# EasyEDA Pro project 集成板.eprj, board 平推转线板3.1
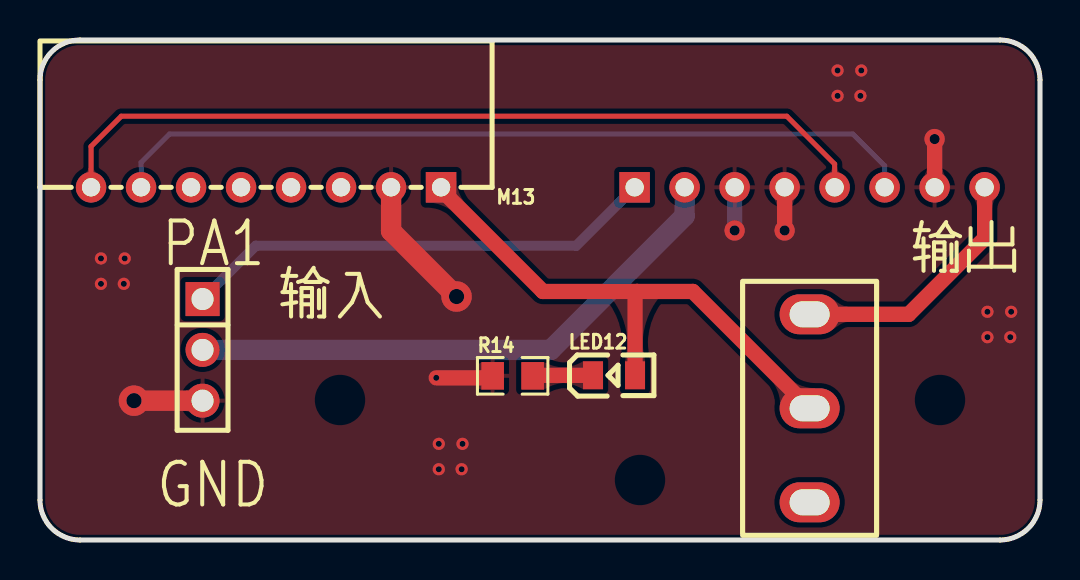
[diagram p8: board, top side]
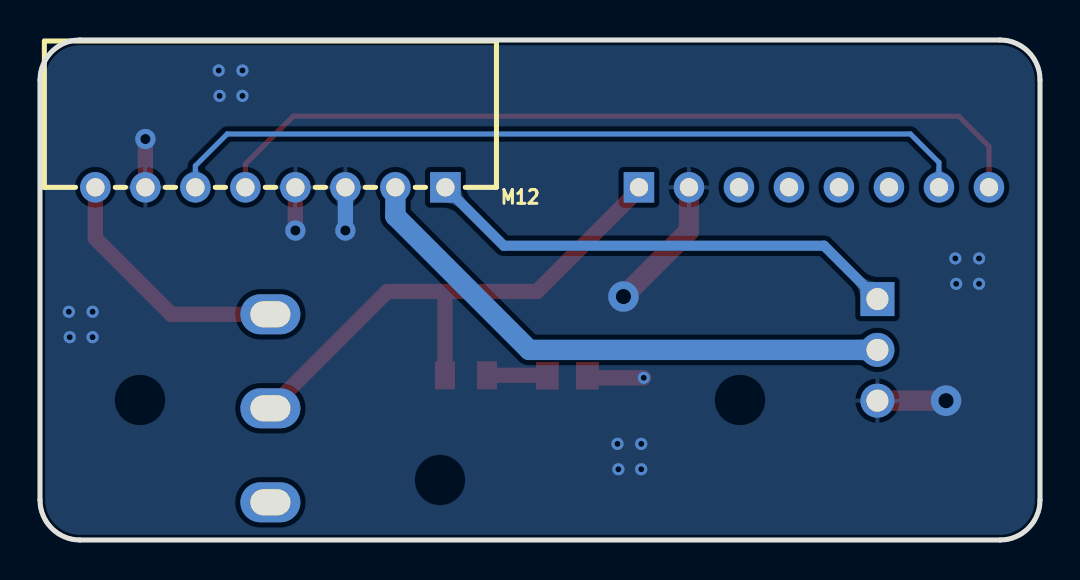
[diagram p9: board, bottom side, seen from below]

Outline 50 x 25 mm; copper layers: Top Layer, Bottom Layer. Coordinates in mm from the lower left corner of the outline.
Outline path: 0,23 0,2 arc(0.59,0.59) 2,0 48,0 arc(49.41,0.59) 50,2 50,23 arc(49.41,24.41) 48,25 2,25 arc(0.59,24.41) 0,23
Stack: Top Layer 0.035mm / Dielectric1 1.51mm FR4 er 4.5 / Bottom Layer 0.035mm

## Design rules (mm)
template: JLCPCB Capability(Two Layers Board)
spacing copperThickness1oz (default): track to track 0.102, other pairs 0.152 to 0.3
spacing copperThickness2oz: track to track 0.203, other pairs 0.152 to 0.3
track width copperThickness1oz (default): min 0.127, default 0.254, max 2.54
track width copperThickness2oz: min 0.203, default 0.254, max 2.54
differential pair differentialPair (default): width min 0.127, default 0.254, max 2.54; gap min 0.152, default 0.152
via viaSize (default): diameter min 0.5, default 0.61, max 10; hole min 0.3, default 0.305, max 6.3

## Placement (name value [footprint] x y rotation side)
LED12  NCD0805G1  [LED0805-R-RD]  28.7 8.24 0 top
M12  ZX-XH2.54-8PWZ  [CONN-TH_8P-P2.50_ZX-XH2.54-8PWZ]  38.48 17.63 0 bottom
M13  ZX-XH2.54-8PWZ  [CONN-TH_8P-P2.50_ZX-XH2.54-8PWZ]  11.3 17.63 180 top
R14  3kΩ  [R0805]  23.63 8.21 0 top
SW2  SS-12D10L5  [SW-TH_SS-12D10L5]  38.48 6.58 270 top
U36  HB-PH3-25413PB2GOP  [HDR-TH_3P-P2.54-V-M]  8.13 9.51 270 top

## Footprints (pads in the part's own frame, mm; a bottom-side part is the same pattern mirrored in y, then rotated)
CONN-TH_8P-P2.50_ZX-XH2.54-8PWZ
  rect 1.524x1.524 hole 0.914: 1(-8.75,0)
  round 1.524 hole 0.914: 2(-6.25,0) 3(-3.75,0) 4(-1.25,0) 5(1.25,0) 6(3.75,0) 7(6.25,0) 8(8.75,0)
HDR-TH_3P-P2.54-V-M
  rect 1.7x1.7 hole 1.1: 1(-2.54,0)
  round 1.7 hole 1.1: 2(0,0) 3(2.54,0)
LED0805-R-RD
  rect 1x1.399 smd: 1(1.05,0) 2(-1.05,0)
R0805
  rect 1.133x1.377 smd: 1(-1,0) 2(1,0)
SW-TH_SS-12D10L5
  oval 2x3 hole 1.3x2: 1(-4.7,0) 2(0,0) 3(4.7,0)

## Nets
8.4V: M12.2 U36.2
12V: M12.8 SW2.1
12V6: LED12.1 M13.1 SW2.2
GND: M12.3 M12.4 M12.7 M13.2 R14.1 U36.3
CAN_H: M12.6 M13.7
CAN_L: M12.5 M13.8
PA1: M12.1 U36.1
$1N1511: LED12.2 R14.2

Pads without a net: M13 3 4 5 6; SW2 3

## Via types
v1: diameter 0.61, hole 0.305, Top Layer to Bottom Layer, 17 vias
v2: diameter 1.524, hole 0.762, Top Layer to Bottom Layer, 2 vias
v3: diameter 1.016, hole 0.508, Top Layer to Bottom Layer, 3 vias

## Routing (per net, layer and track width the routed paths; a pad name or vN(x,y) marks a point on that pad's centre or on a via; arc(x,y) is an arc through that point)
8.4V: length 28.3
  Bottom Layer w1.016: M12.2 32.23,16.2 25.54,9.51 U36.2
12V: length 12.9
  Top Layer w0.762: M12.8 47.23,15.08 43.44,11.28 SW2.1
12V6: length 27.3
  Top Layer w0.762: 29.85,12.43 29.75,12.33 LED12.1 ; 29.85,12.43 25.15,12.43 20.05,17.52 M13.1 ; 29.85,12.43 32.64,12.43 SW2.2
GND: length 19.8
  Top Layer w0.762: R14.1 22.53,8.11 v1(19.81,8.11) ; M12.7 v3(44.73,20.05) ; M12.4 v3(37.23,15.47)
  Top Layer w1.016: v2(20.83,12.17) 17.55,15.45 M13.2 ; U36.3 v2(4.7,6.97)
  Bottom Layer w0.762: M12.3 v3(34.73,15.47)
  vias: v1(3.05,14.08) v1(3.05,12.81) v1(4.23,14.08) v1(4.19,12.81) v1(19.94,4.81) v1(19.94,3.54) v1(21.13,4.81) v1(21.08,3.54) v1(39.88,23.48) v1(39.88,22.21) v1(41.02,22.21) v1(41.06,23.48) v1(47.37,11.41) v1(47.37,10.14) v1(48.51,10.14) v1(48.56,11.41)
CAN_H: length 40.7
  Bottom Layer w0.254: M12.6 42.23,18.71 40.64,20.3 6.48,20.3 5.05,18.88 M13.7
CAN_L: length 42
  Top Layer w0.254: M12.5 39.73,18.8 37.34,21.19 4.06,21.19 2.55,19.68 M13.8
PA1: length 23.9
  Bottom Layer w0.508: M12.1 26.81,14.71 10.79,14.71 U36.1
$1N1511: length 3
  Top Layer w0.762: R14.2 24.66,8.24 LED12.2

## Copper pours and planes (outline as drawn; the poured copper is in the pictures)
GND on Top Layer: -0.76,27.03 51.69,27.03 51.69,-2.69 -0.76,-2.69
GND on Bottom Layer: -0.76,26.91 51.82,26.91 51.82,-2.69 -0.76,-2.69

Small or netless copper shapes (teardrops, artwork), in the pictures only: 19 on Top Layer, 8 on Bottom Layer

## Text on the board
Top Silkscreen Layer: GND | PA1 | 输入 | 输出
